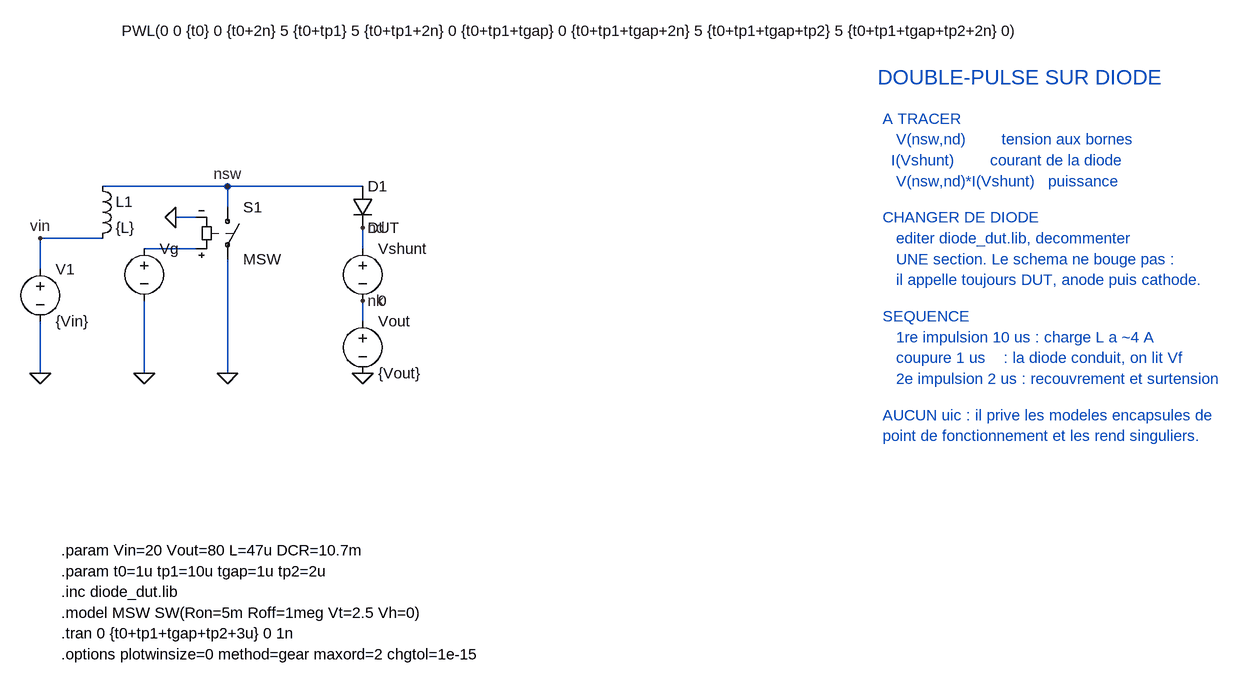
[diagram p0: schematic double_pulse_diode.asc]
double_pulse_diode.asc, the LTspice schematic file:
Version 4.1
SHEET 1 1988 976
WIRE 400 240 208 240
WIRE 608 240 400 240
WIRE 400 272 400 240
WIRE 352 288 320 288
WIRE 208 320 112 320
WIRE 352 336 272 336
WIRE 608 336 608 304
WIRE 112 368 112 320
WIRE 608 448 608 416
WIRE 112 528 112 448
WIRE 272 528 272 416
WIRE 400 528 400 352
FLAG 112 528 0
FLAG 272 528 0
FLAG 400 528 0
FLAG 320 288 0
FLAG 608 528 0
FLAG 112 320 vin
FLAG 400 240 nsw
FLAG 608 304 nd
FLAG 608 416 nk
SYMBOL voltage 112 352 R0
WINDOW 123 0 0 Left 0
WINDOW 39 0 0 Left 0
SYMATTR InstName V1
SYMATTR Value {Vin}
SYMBOL ind 192 224 R0
SYMATTR InstName L1
SYMATTR Value {L}
SYMATTR SpiceLine Rser={DCR}
SYMBOL sw 400 256 R0
SYMATTR InstName S1
SYMATTR Value MSW
SYMBOL voltage 272 320 R0
WINDOW 123 0 0 Left 0
WINDOW 39 0 0 Left 0
WINDOW 3 -35 -319 Left 2
SYMATTR InstName Vg
SYMATTR Value PWL(0 0 {t0} 0 {t0+2n} 5 {t0+tp1} 5 {t0+tp1+2n} 0 {t0+tp1+tgap} 0 {t0+tp1+tgap+2n} 5 {t0+tp1+tgap+tp2} 5 {t0+tp1+tgap+tp2+2n} 0)
SYMBOL diode 592 240 R0
SYMATTR InstName D1
SYMATTR Value DUT
SYMATTR Prefix X
SYMBOL voltage 608 320 R0
WINDOW 123 0 0 Left 0
WINDOW 39 0 0 Left 0
SYMATTR InstName Vshunt
SYMATTR Value 0
SYMBOL voltage 608 432 R0
WINDOW 123 0 0 Left 0
WINDOW 39 0 0 Left 0
SYMATTR InstName Vout
SYMATTR Value {Vout}
TEXT 144 800 Left 2 !.param Vin=20 Vout=80 L=47u DCR=10.7m
TEXT 144 832 Left 2 !.param t0=1u tp1=10u tgap=1u tp2=2u
TEXT 144 864 Left 2 !.inc diode_dut.lib
TEXT 144 896 Left 2 !.model MSW SW(Ron=5m Roff=1meg Vt=2.5 Vh=0)
TEXT 144 928 Left 2 !.tran 0 {t0+tp1+tgap+tp2+3u} 0 1n
TEXT 144 960 Left 2 !.options plotwinsize=0 method=gear maxord=2 chgtol=1e-15
TEXT 1400 72 Left 3 ;DOUBLE-PULSE SUR DIODE
TEXT 1408 136 Left 2 ;A TRACER
TEXT 1408 168 Left 2 ;   V(nsw,nd)        tension aux bornes
TEXT 1400 200 Left 2 ;   I(Vshunt)        courant de la diode
TEXT 1408 232 Left 2 ;   V(nsw,nd)*I(Vshunt)   puissance
TEXT 1408 288 Left 2 ;CHANGER DE DIODE
TEXT 1408 320 Left 2 ;   editer diode_dut.lib, decommenter
TEXT 1408 352 Left 2 ;   UNE section. Le schema ne bouge pas :
TEXT 1408 384 Left 2 ;   il appelle toujours DUT, anode puis cathode.
TEXT 1408 440 Left 2 ;SEQUENCE
TEXT 1408 472 Left 2 ;   1re impulsion 10 us : charge L a ~4 A
TEXT 1408 504 Left 2 ;   coupure 1 us    : la diode conduit, on lit Vf
TEXT 1408 536 Left 2 ;   2e impulsion 2 us : recouvrement et surtension
TEXT 1408 592 Left 2 ;AUCUN uic : il prive les modeles encapsules de
TEXT 1408 624 Left 2 ;point de fonctionnement et les rend singuliers.

The netlist it stands for:
* double_pulse_diode.asc
V1 vin 0 {Vin}
L1 nsw vin {L} Rser={DCR}
S1 nsw 0 N001 0 MSW
Vg N001 0 PWL(0 0 {t0} 0 {t0+2n} 5 {t0+tp1} 5 {t0+tp1+2n} 0 {t0+tp1+tgap} 0 {t0+tp1+tgap+2n} 5 {t0+tp1+tgap+tp2} 5 {t0+tp1+tgap+tp2+2n} 0)
X§D1 nsw nd DUT  ; pins + -
Vshunt nd nk 0
Vout nk 0 {Vout}
.param Vin=20 Vout=80 L=47u DCR=10.7m
.param t0=1u tp1=10u tgap=1u tp2=2u
.inc diode_dut.lib
.model MSW SW(Ron=5m Roff=1meg Vt=2.5 Vh=0)
.tran 0 {t0+tp1+tgap+tp2+3u} 0 1n
.options plotwinsize=0 method=gear maxord=2 chgtol=1e-15
* DOUBLE-PULSE SUR DIODE
* A TRACER
*    V(nsw,nd)        tension aux bornes
*    I(Vshunt)        courant de la diode
*    V(nsw,nd)*I(Vshunt)   puissance
* CHANGER DE DIODE
*    editer diode_dut.lib, decommenter
*    UNE section. Le schema ne bouge pas :
*    il appelle toujours DUT, anode puis cathode.
* SEQUENCE
*    1re impulsion 10 us : charge L a ~4 A
*    coupure 1 us    : la diode conduit, on lit Vf
*    2e impulsion 2 us : recouvrement et surtension
* AUCUN uic : il prive les modeles encapsules de
* point de fonctionnement et les rend singuliers.
.backanno
.end